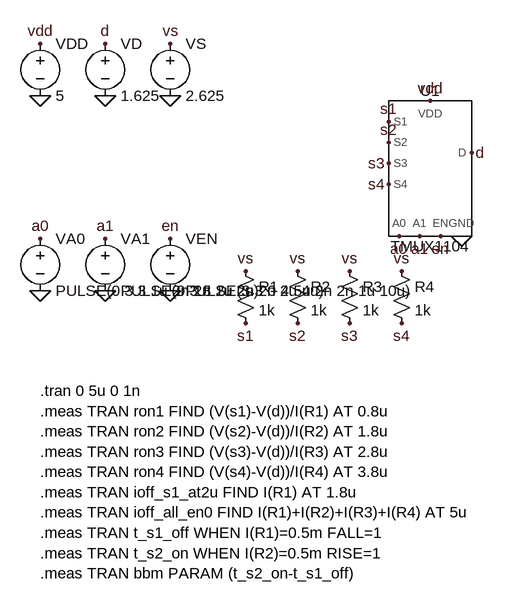
[diagram p0: schematic Model_test_TMUX1104.asc]
Model_test_TMUX1104.asc, the LTspice schematic file:
Version 4
SHEET 1 1400 700
SYMBOL TMUX1104 700 300 R0
SYMATTR InstName U1
FLAG 652 412 a0
FLAG 636 236 s1
FLAG 748 412 0
FLAG 636 300 s3
FLAG 716 412 en
FLAG 700 204 vdd
FLAG 636 332 s4
FLAG 764 284 d
FLAG 636 268 s2
FLAG 684 412 a1
SYMBOL voltage 100 100 R0
SYMATTR InstName VDD
SYMATTR Value 5
FLAG 100 116 vdd
FLAG 100 196 0
SYMBOL voltage 200 100 R0
SYMATTR InstName VD
SYMATTR Value 1.625
FLAG 200 116 d
FLAG 200 196 0
SYMBOL voltage 300 100 R0
SYMATTR InstName VS
SYMATTR Value 2.625
FLAG 300 116 vs
FLAG 300 196 0
SYMBOL res 400 450 R0
SYMATTR InstName R1
SYMATTR Value 1k
FLAG 416 466 vs
FLAG 416 546 s1
SYMBOL res 480 450 R0
SYMATTR InstName R2
SYMATTR Value 1k
FLAG 496 466 vs
FLAG 496 546 s2
SYMBOL res 560 450 R0
SYMATTR InstName R3
SYMATTR Value 1k
FLAG 576 466 vs
FLAG 576 546 s3
SYMBOL res 640 450 R0
SYMATTR InstName R4
SYMATTR Value 1k
FLAG 656 466 vs
FLAG 656 546 s4
SYMBOL voltage 100 400 R0
SYMATTR InstName VA0
SYMATTR Value PULSE(0 3.3 1u 2n 2n 1u 2u)
FLAG 100 416 a0
FLAG 100 496 0
SYMBOL voltage 200 400 R0
SYMATTR InstName VA1
SYMATTR Value PULSE(0 3.3 2u 2n 2n 2u 4u)
FLAG 200 416 a1
FLAG 200 496 0
SYMBOL voltage 300 400 R0
SYMATTR InstName VEN
SYMATTR Value PULSE(3.3 0 4.5u 2n 2n 1u 10u)
FLAG 300 416 en
FLAG 300 496 0
TEXT 100 650 Left 2 !.tran 0 5u 0 1n\n.meas TRAN ron1 FIND (V(s1)-V(d))/I(R1) AT 0.8u\n.meas TRAN ron2 FIND (V(s2)-V(d))/I(R2) AT 1.8u\n.meas TRAN ron3 FIND (V(s3)-V(d))/I(R3) AT 2.8u\n.meas TRAN ron4 FIND (V(s4)-V(d))/I(R4) AT 3.8u\n.meas TRAN ioff_s1_at2u FIND I(R1) AT 1.8u\n.meas TRAN ioff_all_en0 FIND I(R1)+I(R2)+I(R3)+I(R4) AT 5u\n.meas TRAN t_s1_off WHEN I(R1)=0.5m FALL=1\n.meas TRAN t_s2_on WHEN I(R2)=0.5m RISE=1\n.meas TRAN bbm PARAM (t_s2_on-t_s1_off)

The netlist it stands for:
* Model_test_TMUX1104.asc
XU1 a0 s1 0 s3 en vdd s4 d s2 a1 TMUX1104  ; pins A0 S1 GND S3 EN VDD S4 D S2 A1
VDD vdd 0 5
VD d 0 1.625
VS vs 0 2.625
R1 vs s1 1k
R2 vs s2 1k
R3 vs s3 1k
R4 vs s4 1k
VA0 a0 0 PULSE(0 3.3 1u 2n 2n 1u 2u)
VA1 a1 0 PULSE(0 3.3 2u 2n 2n 2u 4u)
VEN en 0 PULSE(3.3 0 4.5u 2n 2n 1u 10u)
.tran 0 5u 0 1n
.meas TRAN ron1 FIND (V(s1)-V(d))/I(R1) AT 0.8u
.meas TRAN ron2 FIND (V(s2)-V(d))/I(R2) AT 1.8u
.meas TRAN ron3 FIND (V(s3)-V(d))/I(R3) AT 2.8u
.meas TRAN ron4 FIND (V(s4)-V(d))/I(R4) AT 3.8u
.meas TRAN ioff_s1_at2u FIND I(R1) AT 1.8u
.meas TRAN ioff_all_en0 FIND I(R1)+I(R2)+I(R3)+I(R4) AT 5u
.meas TRAN t_s1_off WHEN I(R1)=0.5m FALL=1
.meas TRAN t_s2_on WHEN I(R2)=0.5m RISE=1
.meas TRAN bbm PARAM (t_s2_on-t_s1_off)
.lib C:\Users\polus\OneDrive\Pulpit\Projekty\Oscyloskop\Symulacje\TMUX1104.lib
.backanno
.end